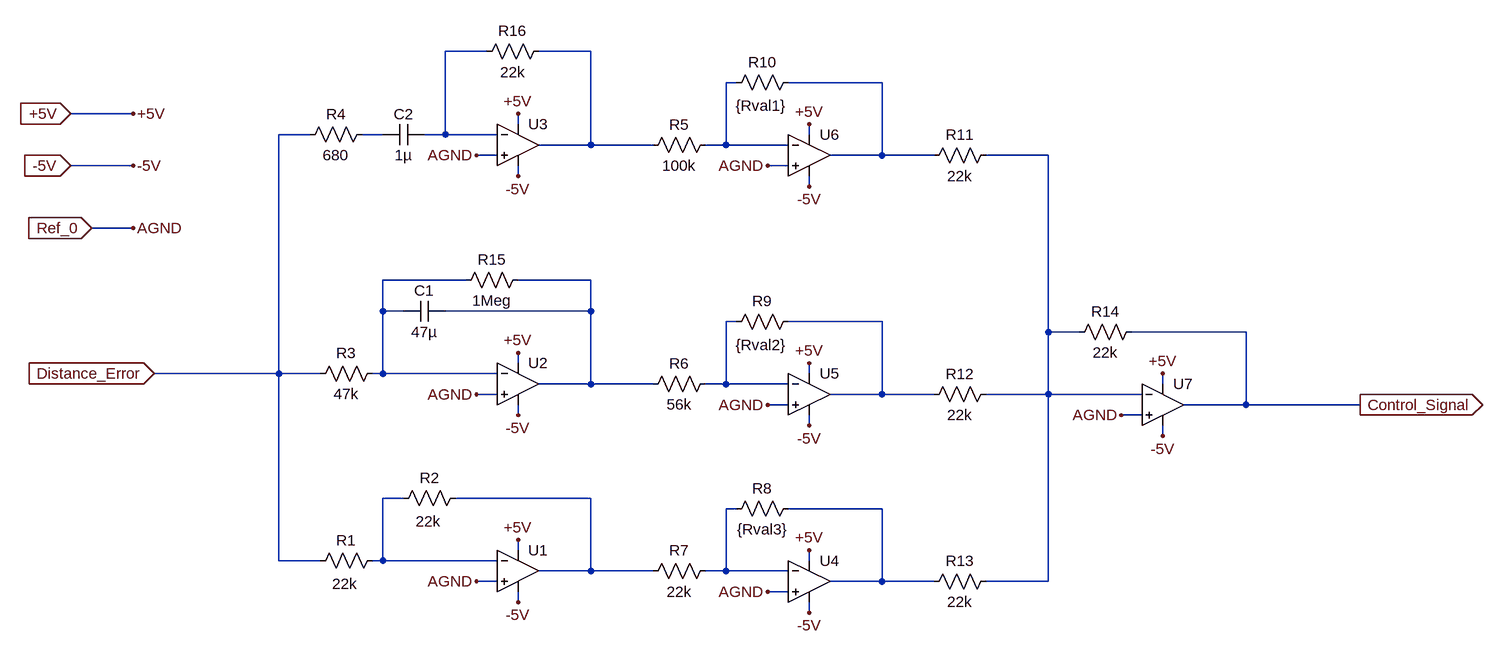
[diagram p0: schematic PID_Controller.asc]
PID_Controller.asc, the LTspice schematic file:
Version 4.1
SHEET 1 1656 680
WIRE 80 -640 16 -640
WIRE 240 -640 160 -640
WIRE 464 -592 448 -592
WIRE 688 -592 544 -592
WIRE -464 -544 -560 -544
WIRE 128 -528 128 -544
WIRE -192 -512 -240 -512
WIRE -80 -512 -112 -512
WIRE 16 -512 16 -640
WIRE 16 -512 -16 -512
WIRE 96 -512 16 -512
WIRE 576 -512 576 -528
WIRE 240 -496 240 -640
WIRE 240 -496 160 -496
WIRE 336 -496 240 -496
WIRE 448 -496 448 -592
WIRE 448 -496 416 -496
WIRE 544 -496 448 -496
WIRE 96 -480 64 -480
WIRE 688 -480 688 -592
WIRE 688 -480 608 -480
WIRE 768 -480 688 -480
WIRE 944 -480 848 -480
WIRE -464 -464 -560 -464
WIRE 544 -464 512 -464
WIRE 128 -448 128 -464
WIRE 576 -432 576 -448
WIRE -464 -368 -528 -368
WIRE 48 -288 -80 -288
WIRE 240 -288 128 -288
WIRE -80 -240 -80 -288
WIRE -48 -240 -80 -240
WIRE 240 -240 240 -288
WIRE 240 -240 16 -240
WIRE 464 -224 448 -224
WIRE 688 -224 544 -224
WIRE 944 -208 944 -480
WIRE 992 -208 944 -208
WIRE 1248 -208 1072 -208
WIRE 128 -160 128 -176
WIRE -240 -144 -240 -512
WIRE -240 -144 -432 -144
WIRE -176 -144 -240 -144
WIRE -80 -144 -80 -240
WIRE -80 -144 -96 -144
WIRE 96 -144 -80 -144
WIRE 576 -144 576 -160
WIRE 240 -128 240 -240
WIRE 240 -128 160 -128
WIRE 336 -128 240 -128
WIRE 448 -128 448 -224
WIRE 448 -128 416 -128
WIRE 544 -128 448 -128
WIRE 1120 -128 1120 -144
WIRE 96 -112 64 -112
WIRE 688 -112 688 -224
WIRE 688 -112 608 -112
WIRE 768 -112 688 -112
WIRE 944 -112 944 -208
WIRE 944 -112 848 -112
WIRE 1088 -112 944 -112
WIRE 544 -96 512 -96
WIRE 1248 -96 1248 -208
WIRE 1248 -96 1152 -96
WIRE 1424 -96 1248 -96
WIRE 128 -80 128 -96
WIRE 1088 -80 1056 -80
WIRE 576 -64 576 -80
WIRE 1120 -48 1120 -64
WIRE -48 48 -80 48
WIRE 240 48 32 48
WIRE 464 64 448 64
WIRE 688 64 544 64
WIRE 128 128 128 112
WIRE -240 144 -240 -144
WIRE -176 144 -240 144
WIRE -80 144 -80 48
WIRE -80 144 -96 144
WIRE 96 144 -80 144
WIRE 576 144 576 128
WIRE 240 160 240 48
WIRE 240 160 160 160
WIRE 336 160 240 160
WIRE 448 160 448 64
WIRE 448 160 416 160
WIRE 544 160 448 160
WIRE 96 176 64 176
WIRE 688 176 688 64
WIRE 688 176 608 176
WIRE 768 176 688 176
WIRE 944 176 944 -112
WIRE 944 176 848 176
WIRE 544 192 512 192
WIRE 128 208 128 192
WIRE 576 224 576 208
FLAG -432 -144 Distance_Error
IOPIN -432 -144 In
FLAG 1424 -96 Control_Signal
IOPIN 1424 -96 Out
FLAG 128 -544 +5V
FLAG 576 -528 +5V
FLAG 128 -176 +5V
FLAG 576 -160 +5V
FLAG 576 128 +5V
FLAG 128 112 +5V
FLAG 1120 -144 +5V
FLAG 128 -448 -5V
FLAG 128 -80 -5V
FLAG 128 208 -5V
FLAG 576 224 -5V
FLAG 576 -64 -5V
FLAG 576 -432 -5V
FLAG 1120 -48 -5V
FLAG 1056 -80 AGND
FLAG 64 -112 AGND
FLAG 64 176 AGND
FLAG 512 192 AGND
FLAG 512 -96 AGND
FLAG 512 -464 AGND
FLAG 64 -480 AGND
FLAG -560 -544 +5V
IOPIN -560 -544 In
FLAG -560 -464 -5V
IOPIN -560 -464 In
FLAG -528 -368 Ref_0
IOPIN -528 -368 In
FLAG -464 -544 +5V
FLAG -464 -464 -5V
FLAG -464 -368 AGND
SYMBOL OpAmps\\UniversalOpAmp2 128 160 R0
SYMATTR InstName U1
SYMATTR Value2 Avol=200k GBW=3Meg Slew=13Meg
SYMATTR SpiceLine Ilimit=25m Rail=1.5 Vos=3m
SYMATTR SpiceLine2 En=18n Enk=100 In=0.01p Ink=10 Rin=1T
SYMBOL res -80 128 R90
WINDOW 0 0 56 VBottom 2
WINDOW 3 36 58 VTop 2
SYMATTR InstName R1
SYMATTR Value 22k
SYMBOL res 48 32 R90
WINDOW 0 0 56 VBottom 2
WINDOW 3 36 58 VTop 2
SYMATTR InstName R2
SYMATTR Value 22k
SYMBOL OpAmps\\UniversalOpAmp2 128 -128 R0
SYMATTR InstName U2
SYMATTR Value2 Avol=200k GBW=3Meg Slew=13Meg
SYMATTR SpiceLine Ilimit=25m Rail=1.5 Vos=3m
SYMATTR SpiceLine2 En=18n Enk=100 In=0.01p Ink=10 Rin=1T
SYMBOL res -80 -160 R90
WINDOW 0 0 56 VBottom 2
WINDOW 3 32 56 VTop 2
SYMATTR InstName R3
SYMATTR Value 47k
SYMBOL cap 16 -256 R90
WINDOW 0 0 32 VBottom 2
WINDOW 3 32 32 VTop 2
SYMATTR InstName C1
SYMATTR Value 47µ
SYMBOL OpAmps\\UniversalOpAmp2 128 -496 R0
SYMATTR InstName U3
SYMATTR Value2 Avol=200k GBW=3Meg Slew=13Meg
SYMATTR SpiceLine Ilimit=25m Rail=1.5 Vos=3m
SYMATTR SpiceLine2 En=18n Enk=100 In=0.01p Ink=10 Rin=1T
SYMBOL cap -16 -528 R90
WINDOW 0 0 32 VBottom 2
WINDOW 3 32 32 VTop 2
SYMATTR InstName C2
SYMATTR Value 1µ
SYMBOL OpAmps\\UniversalOpAmp2 576 176 R0
SYMATTR InstName U4
SYMATTR Value2 Avol=200k GBW=3Meg Slew=13Meg
SYMATTR SpiceLine Ilimit=25m Rail=1.5 Vos=3m
SYMATTR SpiceLine2 En=18n Enk=100 In=0.01p Ink=10 Rin=1T
SYMBOL OpAmps\\UniversalOpAmp2 576 -112 R0
SYMATTR InstName U5
SYMATTR Value2 Avol=200k GBW=3Meg Slew=13Meg
SYMATTR SpiceLine Ilimit=25m Rail=1.5 Vos=3m
SYMATTR SpiceLine2 En=18n Enk=100 In=0.01p Ink=10 Rin=1T
SYMBOL OpAmps\\UniversalOpAmp2 576 -480 R0
SYMATTR InstName U6
SYMATTR Value2 Avol=200k GBW=3Meg Slew=13Meg
SYMATTR SpiceLine Ilimit=25m Rail=1.5 Vos=3m
SYMATTR SpiceLine2 En=18n Enk=100 In=0.01p Ink=10 Rin=1T
SYMBOL res 432 -512 R90
WINDOW 0 0 56 VBottom 2
WINDOW 3 32 56 VTop 2
SYMATTR InstName R5
SYMATTR Value 100k
SYMBOL res 432 -144 R90
WINDOW 0 0 56 VBottom 2
WINDOW 3 32 56 VTop 2
SYMATTR InstName R6
SYMATTR Value 56k
SYMBOL res 560 48 R90
WINDOW 0 0 56 VBottom 2
WINDOW 3 32 56 VTop 2
SYMATTR InstName R8
SYMATTR Value {Rval3}
SYMBOL res 560 -240 R90
WINDOW 0 0 56 VBottom 2
WINDOW 3 36 58 VTop 2
SYMATTR InstName R9
SYMATTR Value {Rval2}
SYMBOL res 560 -608 R90
WINDOW 0 0 56 VBottom 2
WINDOW 3 36 58 VTop 2
SYMATTR InstName R10
SYMATTR Value {Rval1}
SYMBOL res 864 -496 R90
WINDOW 0 0 56 VBottom 2
WINDOW 3 32 56 VTop 2
SYMATTR InstName R11
SYMATTR Value 22k
SYMBOL res 864 -128 R90
WINDOW 0 0 56 VBottom 2
WINDOW 3 32 56 VTop 2
SYMATTR InstName R12
SYMATTR Value 22k
SYMBOL res 864 160 R90
WINDOW 0 0 56 VBottom 2
WINDOW 3 32 56 VTop 2
SYMATTR InstName R13
SYMATTR Value 22k
SYMBOL OpAmps\\UniversalOpAmp2 1120 -96 R0
SYMATTR InstName U7
SYMATTR Value2 Avol=200k GBW=3Meg Slew=13Meg
SYMATTR SpiceLine Ilimit=25m Rail=1.5 Vos=3m
SYMATTR SpiceLine2 En=18n Enk=100 In=0.01p Ink=10 Rin=1T
SYMBOL res 1088 -224 R90
WINDOW 0 0 56 VBottom 2
WINDOW 3 32 56 VTop 2
SYMATTR InstName R14
SYMATTR Value 22k
SYMBOL res 432 144 R90
WINDOW 0 0 56 VBottom 2
WINDOW 3 32 56 VTop 2
SYMATTR InstName R7
SYMATTR Value 22k
SYMBOL res 144 -304 R90
WINDOW 0 0 56 VBottom 2
WINDOW 3 32 56 VTop 2
SYMATTR InstName R15
SYMATTR Value 1Meg
SYMBOL res -96 -528 R90
WINDOW 0 0 56 VBottom 2
WINDOW 3 32 56 VTop 2
SYMATTR InstName R4
SYMATTR Value 680
SYMBOL res 176 -656 R90
WINDOW 0 0 56 VBottom 2
WINDOW 3 32 56 VTop 2
SYMATTR InstName R16
SYMATTR Value 22k

The netlist it stands for:
* PID_Controller.asc
X§U1 Ref_0 N011 +5V -5V N012 level2 Avol=200k GBW=3Meg Slew=13Meg Ilimit=25m Rail=1.5 Vos=3m En=18n Enk=100 In=0.01p Ink=10 Rin=1T  ; pins In+ In- V+ V- OUT
R1 N011 Distance_Error 22k
R2 N012 N011 22k
X§U2 Ref_0 N007 +5V -5V N008 level2 Avol=200k GBW=3Meg Slew=13Meg Ilimit=25m Rail=1.5 Vos=3m En=18n Enk=100 In=0.01p Ink=10 Rin=1T  ; pins In+ In- V+ V- OUT
R3 N007 Distance_Error 47k
C1 N008 N007 47µ
X§U3 Ref_0 N001 +5V -5V N002 level2 Avol=200k GBW=3Meg Slew=13Meg Ilimit=25m Rail=1.5 Vos=3m En=18n Enk=100 In=0.01p Ink=10 Rin=1T  ; pins In+ In- V+ V- OUT
C2 N001 N005 1µ
X§U4 Ref_0 N013 +5V -5V N014 level2 Avol=200k GBW=3Meg Slew=13Meg Ilimit=25m Rail=1.5 Vos=3m En=18n Enk=100 In=0.01p Ink=10 Rin=1T  ; pins In+ In- V+ V- OUT
X§U5 Ref_0 N009 +5V -5V N010 level2 Avol=200k GBW=3Meg Slew=13Meg Ilimit=25m Rail=1.5 Vos=3m En=18n Enk=100 In=0.01p Ink=10 Rin=1T  ; pins In+ In- V+ V- OUT
X§U6 Ref_0 N003 +5V -5V N004 level2 Avol=200k GBW=3Meg Slew=13Meg Ilimit=25m Rail=1.5 Vos=3m En=18n Enk=100 In=0.01p Ink=10 Rin=1T  ; pins In+ In- V+ V- OUT
R5 N003 N002 100k
R6 N009 N008 56k
R8 N014 N013 {Rval3}
R9 N010 N009 {Rval2}
R10 N004 N003 {Rval1}
R11 N006 N004 22k
R12 N006 N010 22k
R13 N006 N014 22k
X§U7 Ref_0 N006 +5V -5V Control_Signal level2 Avol=200k GBW=3Meg Slew=13Meg Ilimit=25m Rail=1.5 Vos=3m En=18n Enk=100 In=0.01p Ink=10 Rin=1T  ; pins In+ In- V+ V- OUT
R14 Control_Signal N006 22k
R7 N013 N012 22k
R15 N008 N007 1Meg
R4 N005 Distance_Error 680
R16 N002 N001 22k
.lib UniversalOpAmp2.lib
.backanno
.end